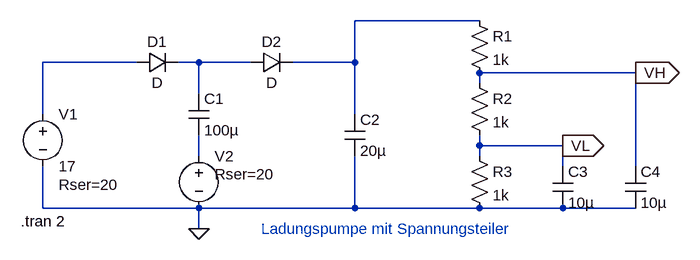
[diagram p0: schematic VoltageDoubler.asc]
VoltageDoubler.asc, the LTspice schematic file:
Version 4
SHEET 1 1036 680
WIRE 704 0 512 0
WIRE 176 64 32 64
WIRE 272 64 240 64
WIRE 352 64 272 64
WIRE 512 64 512 0
WIRE 512 64 416 64
WIRE 944 80 704 80
WIRE 704 96 704 80
WIRE 272 112 272 64
WIRE 32 144 32 64
WIRE 512 144 512 64
WIRE 704 192 704 176
WIRE 832 192 704 192
WIRE 272 208 272 176
WIRE 704 208 704 192
WIRE 832 224 832 192
WIRE 944 224 944 80
WIRE 32 288 32 224
WIRE 272 288 32 288
WIRE 512 288 512 208
WIRE 512 288 272 288
WIRE 704 288 512 288
WIRE 832 288 704 288
WIRE 944 288 832 288
WIRE 272 320 272 288
FLAG 272 320 0
FLAG 944 80 VH
IOPIN 944 80 Out
FLAG 832 192 VL
IOPIN 832 192 Out
SYMBOL voltage 32 128 R0
WINDOW 123 0 0 Left 0
WINDOW 39 24 124 Left 2
SYMATTR InstName V1
SYMATTR Value 17
SYMATTR SpiceLine Rser=20
SYMBOL diode 176 80 R270
WINDOW 0 32 32 VTop 2
WINDOW 3 0 32 VBottom 2
SYMATTR InstName D1
SYMBOL diode 352 80 R270
WINDOW 0 32 32 VTop 2
WINDOW 3 0 32 VBottom 2
SYMATTR InstName D2
SYMBOL cap 256 112 R0
SYMATTR InstName C1
SYMATTR Value 100µ
SYMBOL voltage 272 192 R0
WINDOW 3 24 96 Invisible 2
WINDOW 123 0 0 Left 0
WINDOW 39 24 44 Left 2
SYMATTR InstName V2
SYMATTR Value PULSE(17 0 1m 0 0 1m 2m 99999)
SYMATTR SpiceLine Rser=20
SYMBOL cap 496 144 R0
SYMATTR InstName C2
SYMATTR Value 20µ
SYMBOL res 688 -16 R0
SYMATTR InstName R1
SYMATTR Value 1k
SYMBOL res 688 80 R0
SYMATTR InstName R2
SYMATTR Value 1k
SYMBOL res 688 192 R0
SYMATTR InstName R3
SYMATTR Value 1k
SYMBOL cap 816 224 R0
SYMATTR InstName C3
SYMATTR Value 10µ
SYMBOL cap 928 224 R0
SYMATTR InstName C4
SYMATTR Value 10µ
TEXT -2 308 Left 2 !.tran 2
TEXT 368 320 Left 2 ;Ladungspumpe mit Spannungsteiler

The netlist it stands for:
* VoltageDoubler.asc
V1 N002 0 17 Rser=20
D1 N002 N003 D
D2 N003 N001 D
C1 N003 N004 100µ
V2 N004 0 PULSE(17 0 1m 0 0 1m 2m 99999) Rser=20
C2 N001 0 20µ
R1 N001 VH 1k
R2 VH VL 1k
R3 VL 0 1k
C3 VL 0 10µ
C4 VH 0 10µ
.model D D
.lib standard.dio
.tran 2
* Ladungspumpe mit Spannungsteiler
.backanno
.end